# Altium schematic sheet RS485.SchDoc
size 300 x 200 mm; SheetNumber: 3; SheetTotal: 10
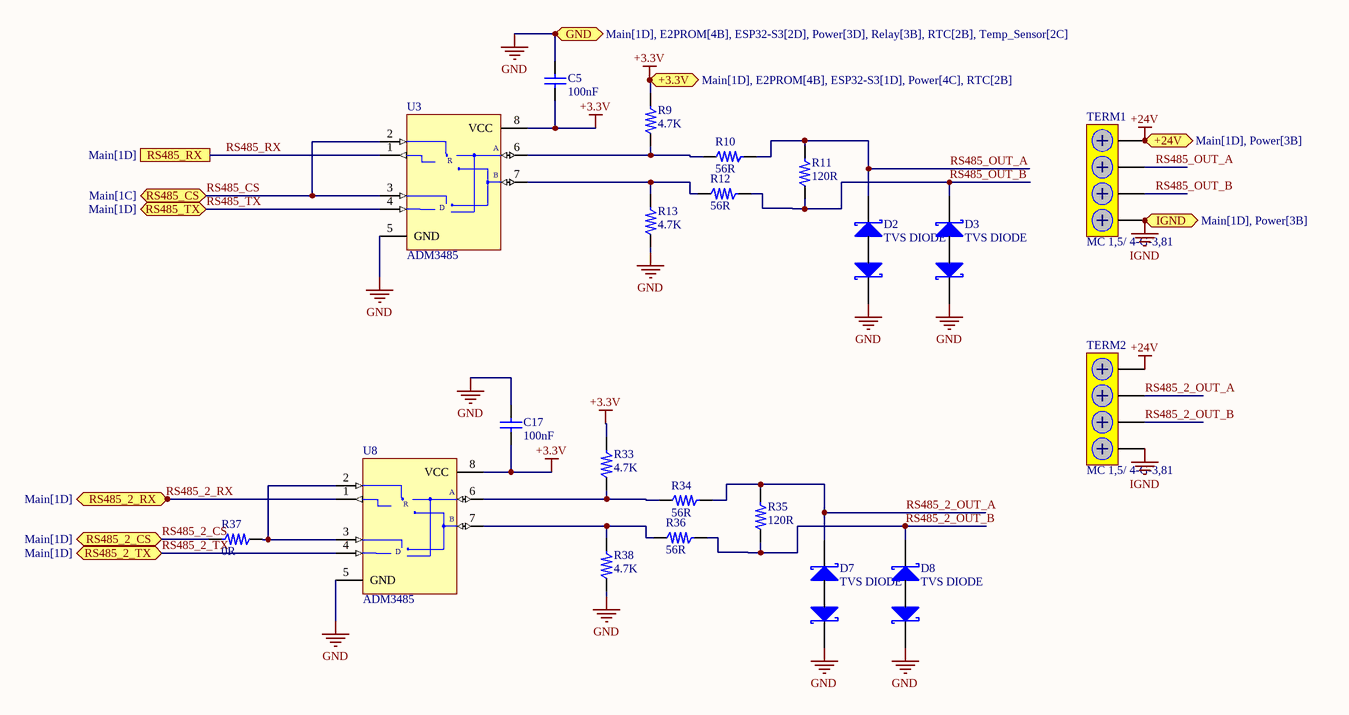
[diagram p0: RS485.SchDoc]

## Parts
C5  100nF  [0805]
C17  100nF  [0805]
D2  TVS DIODE  [DO-214AA]
D3  TVS DIODE  [DO-214AA]
D7  TVS DIODE  [DO-214AA]
D8  TVS DIODE  [DO-214AA]
R9  4.7K  [R0805]
R10  56R  [R0805]
R11  120R  [R0805]
R12  56R  [R0805]
R13  4.7K  [R0805]
R33  4.7K  [R0805]
R34  56R  [R0805]
R35  120R  [R0805]
R36  56R  [R0805]
R37  0R  [R0805]
R38  4.7K  [R0805]
TERM1  MC 1,5/ 4-G-3,81  [MC 1,5/ 4-G-3,81]
TERM2  MC 1,5/ 4-G-3,81  [MC 1,5/ 4-G-3,81]
U3  ADM3485  [NSO8_N]
U8  ADM3485  [NSO8_N]

## Ports
+3.3V (bidir, see Main[1D], E2PROM[4B], ESP32-S3[1D], Power[4C], RTC[2B]), +24V (bidir, see Main[1D], Power[3B]), GND (bidir, see Main[1D], E2PROM[4B], ESP32-S3[2D], Power[3D], Relay[3B], RTC[2B], Temp_Sensor[2C]), IGND (bidir, see Main[1D], Power[3B]), RS485_2_CS (bidir, see Main[1D]), RS485_2_RX (bidir, see Main[1D]), RS485_2_TX (bidir, see Main[1D]), RS485_CS (bidir, see Main[1C]), RS485_RX (see Main[1D]), RS485_TX (bidir, see Main[1D])

## Nets
+3.3V: C5.1 C17.1 R9.2 R33.2 U3.8(VCC) U8.8(VCC) ; port +3.3V
+24V: TERM1.1 TERM2.1 ; port +24V
GND: C5.2 C17.2 D2.1 D3.1 D7.1 D8.1 R13.1 R38.1 U3.5(GND) U8.5(GND) ; port GND
IGND: TERM1.4 TERM2.4 ; port IGND
RS485_2_CS: R37.2 ; port RS485_2_CS
RS485_2_OUT_A: D7.2 R34.2 R35.2 TERM2.2
RS485_2_OUT_B: D8.2 R35.1 R36.2 TERM2.3
RS485_2_RX: U8.1(RO) ; port RS485_2_RX
RS485_2_TX: U8.4(DI) ; port RS485_2_TX
RS485_CS: U3.2(~{RE}) U3.3(DE) ; port RS485_CS
RS485_OUT_A: D2.2 R10.2 R11.2 TERM1.2
RS485_OUT_B: D3.2 R11.1 R12.2 TERM1.3
RS485_RX: U3.1(RO) ; port RS485_RX
RS485_TX: U3.4(DI) ; port RS485_TX
NetR9_1: R9.1 R10.1 U3.6(A)
NetR12_1: R12.1 R13.2 U3.7(B)
NetR33_1: R33.1 R34.1 U8.6(A)
NetR36_1: R36.1 R38.2 U8.7(B)
NetR37_1: R37.1 U8.2(~{RE}) U8.3(DE)

## Notes on the sheet
- (in symbol MAX485CSA) R; D

## Library data of the parts
C5 C17 = 2-Cap: Bipolar Capacitor; Type: MKT
R9-R13 R33-R38 = myRes_1
  R9 R13 R33 R38: Value: 4.7K
  R10 R12 R34 R36: Value: 56R
  R11 R35: Value: 120R
  R37: Value: 0R
U3 U8 = MAX485CSA: Low-Power, Slew-Rate-Limited RS-485/RS-422 Transceiver; Published: 16-Jan-2001; LatestRevisionDate: 13-Apr-2006; LatestRevisionNote: IPC-7351 Footprint Added.; DatasheetVersion: Feb-1996; PackageReference: NSO8; Publisher: Altium Limited; PackageDescription: 8-Pin Small Outline Integrated Circuit 1.27 mm Pitch; Code_JEDEC: MS-012-AA; Code_IPC: SOIC127P600-8; ComponentLink1Description: Manufacturer Link; ComponentLink1URL: http://www.maxim-ic.com/; ComponentLink2Description: Datasheet; ComponentLink2URL: http://pdfserv.maxim-ic.com/en/ds/MAX1487-MAX491.pdf